# Altium project Ethernet-Tester-v1.0.PrjPcb (part 5 of 5)

## Sheet WireMap-Sheet.SchDoc
size A4; SheetNumber: 9; SheetTotal: 8
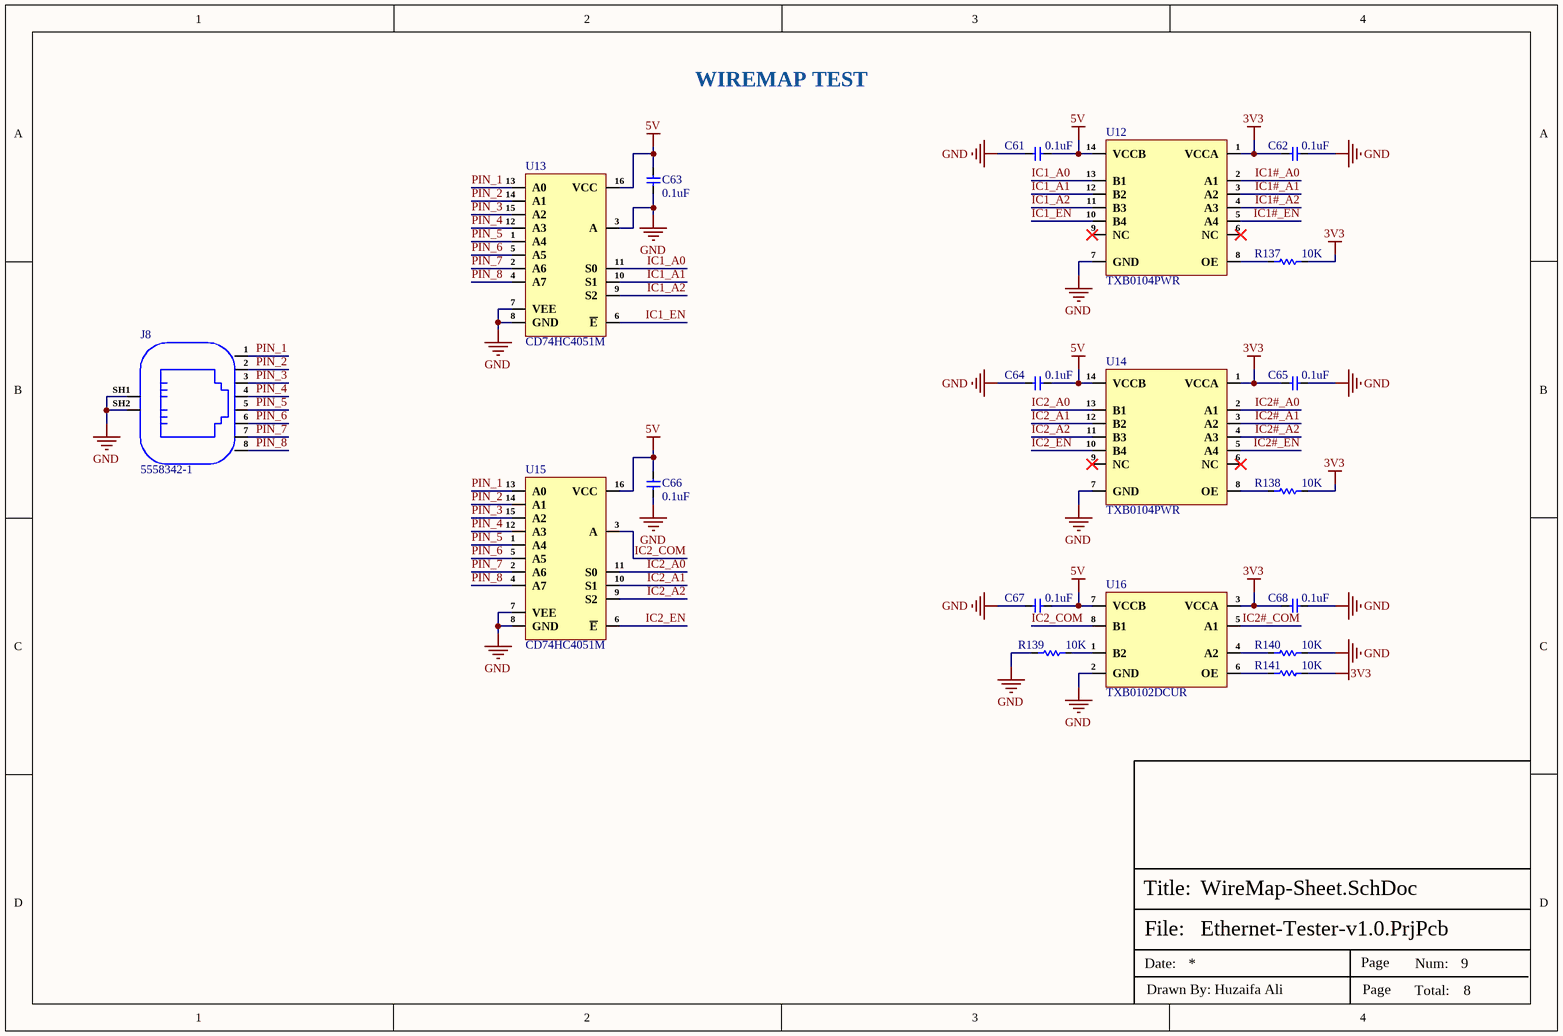
[diagram p8: WireMap-Sheet.SchDoc]

### Parts
C61  0.1uF  [Cap-0402]
C62  0.1uF  [Cap-0402]
C63  0.1uF  [Cap-0402]
C64  0.1uF  [Cap-0402]
C65  0.1uF  [Cap-0402]
C66  0.1uF  [Cap-0402]
C67  0.1uF  [Cap-0402]
C68  0.1uF  [Cap-0402]
J8  5558342-1  [5558342-1]
R137  10K  [Res-0402]
R138  10K  [Res-0402]
R139  10K  [Res-0402]
R140  10K  [Res-0402]
R141  10K  [Res-0402]
U12  TXB0104PWR  [14-TSSOP]
U13  CD74HC4051M  [SOIC-16]
U14  TXB0104PWR  [14-TSSOP]
U15  CD74HC4051M  [SOIC-16]
U16  TXB0102DCUR  [VSSOP-8(3.1x2.1)]

### Nets
3V3: C62.2 C65.2 C68.2 R137.2 R138.2 R141.2 U12.1(VCCA) U14.1(VCCA) U16.3(VCCA)
5V: C61.2 C63.1 C64.2 C66.1 C67.2 U12.14(VCCB) U13.16(VCC) U14.14(VCCB) U15.16(VCC) U16.7(VCCB)
GND: C61.1 C62.1 C63.2 C64.1 C65.1 C66.2 C67.1 C68.1 J8.SH1(SHIELD) J8.SH2(SHIELD) R139.1 R140.2 U12.7(GND) U13.3(A) U13.7(VEE) U13.8(GND) U14.7(GND) U15.7(VEE) U15.8(GND) U16.2(GND)
IC1#_A0: U12.2(A1)
IC1#_A1: U12.3(A2)
IC1#_A2: U12.4(A3)
IC1#_EN: U12.5(A4)
IC1_A0: U12.13(B1) U13.11(S0)
IC1_A1: U12.12(B2) U13.10(S1)
IC1_A2: U12.11(B3) U13.9(S2)
IC1_EN: U12.10(B4) U13.6(~{E})
IC2#_A0: U14.2(A1)
IC2#_A1: U14.3(A2)
IC2#_A2: U14.4(A3)
IC2#_COM: U16.5(A1)
IC2#_EN: U14.5(A4)
IC2_A0: U14.13(B1) U15.11(S0)
IC2_A1: U14.12(B2) U15.10(S1)
IC2_A2: U14.11(B3) U15.9(S2)
IC2_COM: U15.3(A) U16.8(B1)
IC2_EN: U14.10(B4) U15.6(~{E})
PIN_1: J8.1 U13.13(A0) U15.13(A0)
PIN_2: J8.2 U13.14(A1) U15.14(A1)
PIN_3: J8.3 U13.15(A2) U15.15(A2)
PIN_4: J8.4 U13.12(A3) U15.12(A3)
PIN_5: J8.5 U13.1(A4) U15.1(A4)
PIN_6: J8.6 U13.5(A5) U15.5(A5)
PIN_7: J8.7 U13.2(A6) U15.2(A6)
PIN_8: J8.8 U13.4(A7) U15.4(A7)
NetR137_1: R137.1 U12.8(OE)
NetR138_1: R138.1 U14.8(OE)
NetR139_2: R139.2 U16.1(B2)
NetR140_1: R140.1 U16.4(A2)
NetR141_1: R141.1 U16.6(OE)

Not connected (* = marked no-connect by the designer): U12 6(NC)* 9(NC)*; U14 6(NC)* 9(NC)*

### Notes on the sheet
- WIREMAP TEST
- File:
- Title:
- Date:
- Page
- Num:
- Total:
- Drawn By: Huzaifa Ali

### Library data of the parts
C61-C68 = CC0402JRX7R7BB104: CAP CER 0.1UF 16V X7R 0402; Manufacturer: Yageo; Material: 4241ConductorMaterial; Value: 100nF; Tolerance: 5%; Item Type: Capacitor; Supplier: Digikey; Supplier Part Number: 311-1676-1-ND; Manufacturer Part Number: CC0402JRX7R7BB104; RoHS: Yes; Category: Ceramic Capacitors; Stock: 1659111; Pricing: 1=0.1, 10=0.046, 50=0.0262, 100=0.0203, 500=0.01528, 1000=0.012, 2500=0.01091, 5000=0.01004 (USD); Mounting Technology: Surface Mount; Case/Package: 0402; Case Code (Metric): 1005; Case Code (Imperial): 0402; Min Operating Temperature: -55°C; Max Operating Temperature: 125°C; Dielectric: X7R; Packaging: Tape and Reel; Package Quantity: 10000; Voltage Rating (DC): 16V; Voltage Rating: 16V; Series: CC; Construction: Flat; Length: 0.039inch; Width: 0.02inch; Height: 0.5mm; Thickness: 0.022inch; Lead Free: Lead Free; Halogen Free: Halogen Free; RoHS Compliant: Yes; ComponentLink1URL: https://datasheet.ciiva.com/13210/upy-gphc-x7r-6-3v-to-50v-8-12304-13210152.pdf?src-supplier=Mouser; ComponentLink1Description: https://datasheet.ciiva.com/13210/upy-gphc-x7r-6-3v-to-50v-8-12304-13210152.pdf?src-supplier=Mouser; LCSC Part Number: C541464
J8 = 5558342-1: CONN MOD JACK 8P8C R/A SHIELDED; Manufacturer: TE Connectivity; Item Type: Ethernet Connectors; Current Rating: 200mA; Circuit Application: 5778ConnectorType; Plating Thickness: 1.27um; Supplier: Future Electronics; LCSC Part Number: C305973; Manufacturer Part Number: 5558342-1; RoHS: No; Stock: 5400; Pricing: 1=2.48, 25=2.38, 75=2.32, 90=2.34, 180=2.3, 200=2.26, 270=2.28, 450=2.25, 500=2.15, 900=2.19 (USD); Lead Free: 5697LeadFree; ComponentLink1URL: https://datasheet.ciiva.com/8007/1637342-8007798.pdf?src-supplier=Element14; ComponentLink1Description: https://datasheet.ciiva.com/8007/1637342-8007798.pdf?src-supplier=Element14; ComponentLink2URL: https://datasheet.ciiva.com/15170/getdatasheetpartid-155261-15170633.pdf?src-supplier=Verical; ComponentLink2Description: https://datasheet.ciiva.com/15170/getdatasheetpartid-155261-15170633.pdf?src-supplier=Verical; ComponentLink3URL: https://datasheet.ciiva.com/30494/0900766b8121ec01-30494367.pdf?src-supplier=Rs; ComponentLink3Description: https://datasheet.ciiva.com/30494/0900766b8121ec01-30494367.pdf?src-supplier=Rs; ComponentLink4URL: https://datasheet.ciiva.com/685/eng-cd-5558342-f-basefilename-685330.pdf?src-supplier=Digikey; ComponentLink4Description: https://datasheet.ciiva.com/685/eng-cd-5558342-f-basefilename-685330.pdf?src-supplier=Digikey; ComponentLink5URL: https://datasheet.ciiva.com/19457/958999-19457716.pdf?src-supplier=Jameco; ComponentLink5Description: https://datasheet.ciiva.com/19457/958999-19457716.pdf?src-supplier=Jameco; ComponentLink6URL: https://datasheet.ciiva.com/14618/70042946-14618796.pdf?src-supplier=Allied+Electronics; ComponentLink6Description: https://datasheet.ciiva.com/14618/70042946-14618796.pdf?src-supplier=Allied+Electronics; ComponentLink7URL: https://datasheet.ciiva.com/30242/eng-cs-82066-mod-jacks-and-mrj21-prod-single-1107-30242663.pdf?src-supplier=Onlinecomponents.com; ComponentLink7Description: https://datasheet.ciiva.com/30242/eng-cs-82066-mod-jacks-and-mrj21-prod-single-1107-30242663.pdf?src-supplier=Onlinecomponents.com; ComponentLink8URL: https://datasheet.ciiva.com/3138/eng-cs-82066-mod-jacks-and-mrj21-prod-single-1107-3138695.pdf?src-supplier=Avnet; ComponentLink8Description: https://datasheet.ciiva.com/3138/eng-cs-82066-mod-jacks-and-mrj21-prod-single-1107-3138695.pdf?src-supplier=Avnet
R137-R141 = RC0402FR-0710KL: RES 10K OHM 1% 1/16W 0402; Manufacturer: Yageo; Resistance: 10kR; Voltage Rating (DC): 50V; Temperature Coefficient: 100ppm/°C; Power Rating: 62.5mW; Max Power Dissipation: 63mW; Item Type: Resistor; Supplier 1: Mouser; Manufacturer Part Number: RC0402FR-0710KL; RoHS: Yes; Category: Chip SMD Resistors; Stock 1: 18648329; Pricing 1: 1=0.10000, 10=0.01400, 50=0.01400, 100=0.00500, 1000=0.00300, 10000=0.00200 (USD); Case/Package: 0402; Number of Pins: 2; Case Code (Imperial): 0402; Case Code (Metric): 1005; Min Operating Temperature: -55°C; Max Operating Temperature: 155°C; Resistor Type: Thick Film; Tolerance: 1%; Packaging: Tape and Reel; Voltage Rating: 50V; Termination: SMD/SMT; Working Voltage: 50V; Number of Terminations: 2; Features: Moisture Resistant; Series: RC; Resistance Tolerance: 1%; Construction: Rectangular; Length: 1mm; Width: 0.5mm; Height: 0.32mm; Depth: 0.5mm; Lead Pitch: 0.2mm; REACH SVHC: No SVHC; Lead Free: Lead Free; RoHS Compliant: Yes; Military Standard: Not; ComponentLink1URL: https://datasheet.ciiva.com/7660/38568-7660787.pdf?src-supplier=Element14; ComponentLink1Description: https://datasheet.ciiva.com/7660/38568-7660787.pdf?src-supplier=Element14; ComponentLink2URL: https://datasheet.ciiva.com/7849/1686128-7849814.pdf?src-supplier=Element14; ComponentLink2Description: https://datasheet.ciiva.com/7849/1686128-7849814.pdf?src-supplier=Element14; ComponentLink3URL: https://datasheet.ciiva.com/7983/1018594-7983486.pdf?src-supplier=Element14; ComponentLink3Description: https://datasheet.ciiva.com/7983/1018594-7983486.pdf?src-supplier=Element14; ComponentLink4URL: https://datasheet.ciiva.com/22747/1018594-22747512.pdf?src-supplier=Element14; ComponentLink4Description: https://datasheet.ciiva.com/22747/1018594-22747512.pdf?src-supplier=Element14; ComponentLink5URL: https://datasheet.ciiva.com/12667/pyu-rc0402-51-rohs-l-6-r-12667067.pdf?src-supplier=Mouser; ComponentLink5Description: https://datasheet.ciiva.com/12667/pyu-rc0402-51-rohs-l-6-r-12667067.pdf?src-supplier=Mouser; ComponentLink6URL: https://datasheet.ciiva.com/7849/1784430-7849813.pdf?src-supplier=Element14; ComponentLink6Description: https://datasheet.ciiva.com/7849/1784430-7849813.pdf?src-supplier=Element14; ComponentLink7URL: https://datasheet.ciiva.com/7849/1784430-7849815.pdf?src-supplier=Element14; ComponentLink7Description: https://datasheet.ciiva.com/7849/1784430-7849815.pdf?src-supplier=Element14; Supplier Part Number 1: 603-RC0402FR-0710KL; LCSC Part Number: C60490
U12 U14 = TXB0104PWR: 4-Bit Bidirectional Voltage-Level Shifter with Auto Direction Sensing and +/-15 kV ESD Protect 14-TSSOP -40 to 85; Manufacturer: Texas Instruments; Number of Outputs: 4NUMBER; Min Supply Voltage (DC): 1.2V; Item Type: IC; Supplier: Digikey; Supplier Part Number: 296-21929-1-ND; Manufacturer Part Number: TXB0104PWR; RoHS: Yes; Category: Voltage Level Shifters; Stock: 5613; Pricing: 1=0.98, 10=0.878, 25=0.8336, 100=0.6848, 250=0.64012, 500=0.56568, 1000=0.44659 (USD); Thickness: 1mm; ComponentLink1URL: https://datasheet.ciiva.com/15096/getdatasheetpartid-48026-15096134.pdf?src-supplier=Verical; ComponentLink1Description: https://datasheet.ciiva.com/15096/getdatasheetpartid-48026-15096134.pdf?src-supplier=Verical; ComponentLink2URL: https://datasheet.ciiva.com/22653/1845221-22653354.pdf?src-supplier=Farnell; ComponentLink2Description: https://datasheet.ciiva.com/22653/1845221-22653354.pdf?src-supplier=Farnell; ComponentLink3URL: https://datasheet.ciiva.com/1508/1633692-1508723.pdf?src-supplier=Element14; ComponentLink3Description: https://datasheet.ciiva.com/1508/1633692-1508723.pdf?src-supplier=Element14; ComponentLink4URL: https://datasheet.ciiva.com/1899/txb0104-1899514.pdf?src-supplier=Digikey; ComponentLink4Description: https://datasheet.ciiva.com/1899/txb0104-1899514.pdf?src-supplier=Digikey; ComponentLink5URL: https://datasheet.ciiva.com/1899/txb0104-1899515.pdf?src-supplier=Digikey; ComponentLink5Description: https://datasheet.ciiva.com/1899/txb0104-1899515.pdf?src-supplier=Digikey; ComponentLink6URL: https://datasheet.ciiva.com/1899/txb0104-1899516.pdf?src-supplier=Digikey; ComponentLink6Description: https://datasheet.ciiva.com/1899/txb0104-1899516.pdf?src-supplier=Digikey; ComponentLink7URL: https://datasheet.ciiva.com/14287/txb0104-14287375.pdf?src-supplier=Avnet; ComponentLink7Description: https://datasheet.ciiva.com/14287/txb0104-14287375.pdf?src-supplier=Avnet; ComponentLink8URL: https://datasheet.ciiva.com/46395/1864432-46395886.pdf?src-supplier=Element14; ComponentLink8Description: https://datasheet.ciiva.com/46395/1864432-46395886.pdf?src-supplier=Element14; ComponentLink9URL: https://datasheet.ciiva.com/1508/1849862-1508724.pdf?src-supplier=Element14; ComponentLink9Description: https://datasheet.ciiva.com/1508/1849862-1508724.pdf?src-supplier=Element14; Package: 14-TSSOP; LCSC Part Number: C60708
U13 U15 = CD74HC4051M: IC MUX 8:1 130OHM 16SOIC; Manufacturer: Texas Instruments; Bandwidth: 180MHz; Propagation Delay: 60ns; Min Supply Voltage: 2V; Max Supply Voltage: 6V; Dual Supply Voltage: 3V; Number of Channels: 1; Min Dual Supply Voltage: 1V; Max Dual Supply Voltage: 5V; Number of Bits: 8NUMBER; On-State Resistance: 130R; Logic Function: Multiplexer,Demultiplexer; Supply Type: Single,Dual; High Level Output Current: 25mA; Number of Inputs: 8; Supply Current: 16uA; Polarity: 4900Direction; Drain to Source Resistance: 40R; Supplier: Mouser; LCSC Part Number: C139301; Manufacturer Part Number: CD74HC4051M; RoHS: Yes; Item Type: IC; Stock: 39065; Pricing: 1=1.23, 10=0.729, 50=0.729, 100=0.729, 1000=0.501, 10000=0.462 (USD); Mounting Technology: Surface Mount; Case/Package: SOIC; Pins: 16; Weight: 0.004998oz; Contact Plating: Gold; Min Operating Temperature: -55°C; Max Operating Temperature: 125°C; Packaging: Rail/Tube; Series: 74HC; Package Quantity: 40; Low Level Output Current: 25mA; Number of Circuits: 1; Number of Outputs: 1; Number of Switches: 1; Thickness: 1.58mm; Radiation Hardening: No; Lead Free: 5697LeadFree; RoHS Compliant: Yes; Reach SVHC Compliant: No; ComponentLink1URL: https://datasheet.ciiva.com/15127/getdatasheetpartid-83108-15127036.pdf?src-supplier=Verical; ComponentLink1Description: https://datasheet.ciiva.com/15127/getdatasheetpartid-83108-15127036.pdf?src-supplier=Verical; ComponentLink2URL: https://datasheet.ciiva.com/6636/cd74hc4051-6636827.pdf?src-supplier=Digikey; ComponentLink2Description: https://datasheet.ciiva.com/6636/cd74hc4051-6636827.pdf?src-supplier=Digikey; ComponentLink3URL: https://datasheet.ciiva.com/1171/1840262-1171371.pdf?src-supplier=Element14; ComponentLink3Description: https://datasheet.ciiva.com/1171/1840262-1171371.pdf?src-supplier=Element14
U16 = TXB0102DCUR: IC TRANSLTR BIDIRECTIONAL 8VSSOP; Manufacturer: Texas Instruments; Number of Circuits: 1; Nominal Supply Current: 3.5uA; Number of Inputs: 1NUMBER; Max Supply Voltage: 5.5V; Min Supply Voltage: 1.2V; Propagation Delay: 7.4ns; Data Rate: 100Mbps; Logic Function: Translator; Number of Bits: 2; Turn-On Delay Time: 31ns; High Level Output Current: -20uA; Low Level Output Current: 20uA; Output Type: 3-STATE; Supplier: Digikey; Supplier Part Number: 296-22862-1-ND; Manufacturer Part Number: TXB0102DCUR; RoHS: Yes; Category: Voltage Level Shifters; Stock: 10593; Pricing: 1=0.69, 10=0.606, 25=0.5696, 100=0.4649, 250=0.4318, 500=0.36748, 1000=0.29398 (USD); Mounting Technology: Surface Mount; Case/Package: VSSOP; Pins: 8; Weight: 0.000339oz; Min Operating Temperature: -40°C; Max Operating Temperature: 85°C; Number of Outputs: 1NUMBER; Packaging: Tape and Reel; Package Quantity: 3000; Series: -; Channel Type: Bidirectional; Length: 2.3mm; Width: 2mm; Height: 900um; Thickness: 850um; Radiation Hardening: No; Reach SVHC Compliant: No; Lead Free: Lead Free; RoHS Compliant: Yes; ComponentLink1URL: https://datasheet.ciiva.com/7744/1634161-7744195.pdf?src-supplier=Element14; ComponentLink1Description: https://datasheet.ciiva.com/7744/1634161-7744195.pdf?src-supplier=Element14; ComponentLink2URL: https://datasheet.ciiva.com/22677/1699360-22677930.pdf?src-supplier=Element14; ComponentLink2Description: https://datasheet.ciiva.com/22677/1699360-22677930.pdf?src-supplier=Element14; ComponentLink3URL: https://datasheet.ciiva.com/4226/sces641b-4226960.pdf?src-supplier=Arrow+Electronics; ComponentLink3Description: https://datasheet.ciiva.com/4226/sces641b-4226960.pdf?src-supplier=Arrow+Electronics; ComponentLink4URL: https://datasheet.ciiva.com/15096/getdatasheetpartid-214907-15096235.pdf?src-supplier=Verical; ComponentLink4Description: https://datasheet.ciiva.com/15096/getdatasheetpartid-214907-15096235.pdf?src-supplier=Verical; ComponentLink5URL: https://datasheet.ciiva.com/6132/txb0102-6132717.pdf?src-supplier=Farnell; ComponentLink5Description: https://datasheet.ciiva.com/6132/txb0102-6132717.pdf?src-supplier=Farnell; ComponentLink6URL: https://datasheet.ciiva.com/46384/1874809-46384198.pdf?src-supplier=Element14; ComponentLink6Description: https://datasheet.ciiva.com/46384/1874809-46384198.pdf?src-supplier=Element14; ComponentLink7URL: https://datasheet.ciiva.com/1899/txb0102-1899430.pdf?src-supplier=Digikey; ComponentLink7Description: https://datasheet.ciiva.com/1899/txb0102-1899430.pdf?src-supplier=Digikey; ComponentLink8URL: https://datasheet.ciiva.com/1899/txb0102-1899429.pdf?src-supplier=Digikey; ComponentLink8Description: https://datasheet.ciiva.com/1899/txb0102-1899429.pdf?src-supplier=Digikey; ComponentLink9URL: https://datasheet.ciiva.com/1899/txb0102-1899431.pdf?src-supplier=Digikey; ComponentLink9Description: https://datasheet.ciiva.com/1899/txb0102-1899431.pdf?src-supplier=Digikey; ComponentLink10URL: https://datasheet.ciiva.com/14287/txb0102-14287496.pdf?src-supplier=Avnet; ComponentLink10Description: https://datasheet.ciiva.com/14287/txb0102-14287496.pdf?src-supplier=Avnet; LCSC Part Number: C60709; Type: IC; ComponentLink11Description: LCSC; ComponentLink11URL: https://www.lcsc.com/product-detail/Translators-Level-Shifters_Texas-Instruments-TXB0102DCUR_C60709.html

## Nets that join several sheets
3V3: Power-Sheet (C6.2 U3.4), Controller-Sheet-1 (25 pins), Controller-Sheet-2 (J3.1 R45.1), USB-Sheet (R65.2 R66.2 R67.2 R68.2), TFT-Display-Sheet (9 pins), Ethernet-PHY-Sheet (8 pins), PoE-Sheet (5 pins), WireMap-Sheet (9 pins)
5V: Power-Sheet (6 pins), USB-Sheet (U5.5), WireMap-Sheet (10 pins)
GND: Power-Sheet (22 pins), Controller-Sheet-1 (24 pins), Controller-Sheet-2 (13 pins), Controller-Sheet-3 (D2.2 J4.3), USB-Sheet (12 pins), TFT-Display-Sheet (5 pins), Ethernet-PHY-Sheet (17 pins), PoE-Sheet (16 pins), WireMap-Sheet (20 pins)
SHIELD: Ethernet-PHY-Sheet (C45.1), PoE-Sheet (C49.1 C57.1 J7.S1 J7.S2)
BAT_STAT: Power-Sheet (R6.1), Controller-Sheet-2 (R15.1)
DA_OUT_N: Ethernet-PHY-Sheet (T1.14), PoE-Sheet (T2.12)
DA_OUT_P: Ethernet-PHY-Sheet (T1.16), PoE-Sheet (T2.11)
DB_OUT_N: Ethernet-PHY-Sheet (R96.2), PoE-Sheet (T2.5)
DB_OUT_P: Ethernet-PHY-Sheet (T1.11), PoE-Sheet (T2.6)
DC_OUT_N: Ethernet-PHY-Sheet (T1.9), PoE-Sheet (T2.3)
DC_OUT_P: Ethernet-PHY-Sheet (R96.1), PoE-Sheet (T2.2)
DD_OUT_N: Ethernet-PHY-Sheet (R98.1), PoE-Sheet (T2.8)
DD_OUT_P: Ethernet-PHY-Sheet (R98.2), PoE-Sheet (T2.9)
IC1#_A0: Controller-Sheet-3 (R55.2), WireMap-Sheet (U12.2)
IC1#_A1: Controller-Sheet-3 (R56.2), WireMap-Sheet (U12.3)
IC1#_A2: Controller-Sheet-3 (R57.2), WireMap-Sheet (U12.4)
IC1#_EN: Controller-Sheet-3 (R61.2), WireMap-Sheet (U12.5)
IC2#_A0: Controller-Sheet-3 (R48.2), WireMap-Sheet (U14.2)
IC2#_A1: Controller-Sheet-3 (R50.2), WireMap-Sheet (U14.3)
IC2#_A2: Controller-Sheet-3 (R52.2), WireMap-Sheet (U14.4)
IC2#_COM: Controller-Sheet-3 (R46.2), WireMap-Sheet (U16.5)
IC2#_EN: Controller-Sheet-3 (R54.2), WireMap-Sheet (U14.5)
LCF: Controller-Sheet-3 (R53.1), PoE-Sheet (R123.1 U7.13)
LED1: Ethernet-PHY-Sheet (U6.3), PoE-Sheet (J7.9)
LED2: Ethernet-PHY-Sheet (U6.2), PoE-Sheet (J7.11 R112.1)
NCL: Controller-Sheet-3 (R51.1), PoE-Sheet (R120.1 U7.16)
NCM: Controller-Sheet-3 (R49.1), PoE-Sheet (R117.1 U7.15)
NRST: Controller-Sheet-2 (C28.2 J3.3 SW3.1 U4.25), Ethernet-PHY-Sheet (R101.1)
PGOOD: Controller-Sheet-3 (R47.1), PoE-Sheet (Q9.3 R133.1)
POE_VOLTS: Controller-Sheet-2 (R22.2), PoE-Sheet (D12.2 R132.1 R135.2)
RMII_CRS_DV: Controller-Sheet-2 (R24.2), Ethernet-PHY-Sheet (R100.1)
RMII_MDC: Controller-Sheet-2 (R41.2), Ethernet-PHY-Sheet (U6.13)
RMII_MDIO: Controller-Sheet-2 (R18.2), Ethernet-PHY-Sheet (R88.2 U6.12)
RMII_REF_CLK: Controller-Sheet-2 (R16.2), Ethernet-PHY-Sheet (R102.1)
RMII_RXD0: Controller-Sheet-2 (R42.2), Ethernet-PHY-Sheet (R94.1)
RMII_RXD1: Controller-Sheet-2 (R43.2), Ethernet-PHY-Sheet (R95.1)
RMII_TX_EN: Controller-Sheet-3 (R63.1), Ethernet-PHY-Sheet (U6.16)
RMII_TXD0: Controller-Sheet-3 (R64.1), Ethernet-PHY-Sheet (U6.17)
RMII_TXD1: Controller-Sheet-2 (R37.1), Ethernet-PHY-Sheet (U6.18)
SPI2_CS: Controller-Sheet-2 (R35.1), TFT-Display-Sheet (R72.1)
SPI2_MISO: Controller-Sheet-2 (R39.1), TFT-Display-Sheet (R77.1)
SPI2_MOSI: Controller-Sheet-2 (R40.1), TFT-Display-Sheet (R76.1)
SPI2_SCK: Controller-Sheet-2 (R31.1), TFT-Display-Sheet (R74.1)
SWCLK: Controller-Sheet-2 (J3.4 R38.2), Controller-Sheet-3 (D2.3)
SWDIO: Controller-Sheet-2 (J3.2 R36.2), Controller-Sheet-3 (D2.4)
SWO: Controller-Sheet-2 (J3.6 R21.1), Controller-Sheet-3 (D2.1)
TFT_BL: Controller-Sheet-2 (R19.1), TFT-Display-Sheet (R83.1)
TFT_DC: Controller-Sheet-2 (R29.1), TFT-Display-Sheet (R73.1)
TFT_RD: Controller-Sheet-2 (R27.1), TFT-Display-Sheet (R75.1)
TFT_RST: Controller-Sheet-2 (R17.1), TFT-Display-Sheet (J6.27 R78.1)
TFT_TE: Controller-Sheet-2 (R33.1), TFT-Display-Sheet (R71.1)
USB_FS_ID: Controller-Sheet-2 (R30.2), USB-Sheet (D5.1 J5.4)
USB_FS_N: Controller-Sheet-2 (R32.2), USB-Sheet (D4.1)
USB_FS_OVCR: Controller-Sheet-3 (R62.1), USB-Sheet (LED1.2 R66.1 U5.3)
USB_FS_P: Controller-Sheet-2 (R34.2), USB-Sheet (D4.3)
USB_FS_PWR_EN: Controller-Sheet-3 (R60.2), USB-Sheet (R67.1 U5.4)
USB_FS_VBUS: Controller-Sheet-2 (R28.2), USB-Sheet (5 pins)